# Altium schematic sheet CLLC_SecondarySide_v1.SchDoc
size A; SheetNumber: 1; SheetTotal: 2
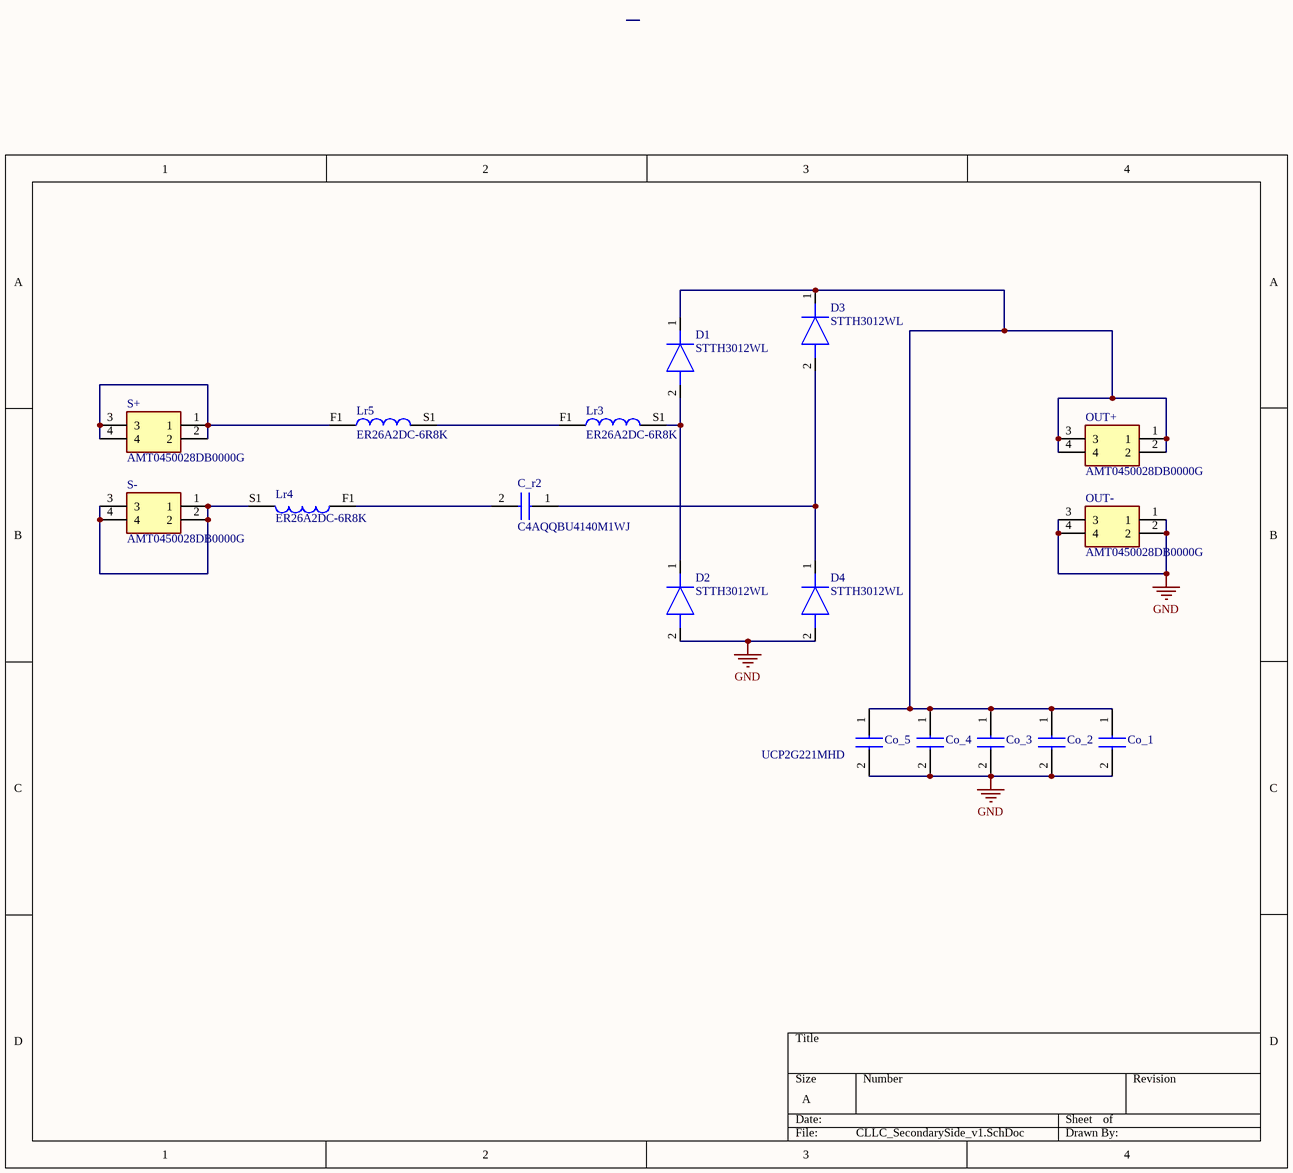
[diagram p0: CLLC_SecondarySide_v1.SchDoc]

## Parts
C_r2  C4AQQBU4140M1WJ  [C4AQQBU4140M1WJ]
Co_1  UCP2G221MHD  [CAPPRD750W80D1800H4800]  (value not drawn)
Co_2  UCP2G221MHD  [CAPPRD750W80D1800H4800]  (value not drawn)
Co_3  UCP2G221MHD  [CAPPRD750W80D1800H4800]  (value not drawn)
Co_4  UCP2G221MHD  [CAPPRD750W80D1800H4800]  (value not drawn)
Co_5  UCP2G221MHD  [CAPPRD750W80D1800H4800]
D1  STTH3012WL  [TO1088P531X1588X2596-2P]
D2  STTH3012WL  [TO1088P531X1588X2596-2P]
D3  STTH3012WL  [TO1088P531X1588X2596-2P]
D4  STTH3012WL  [TO1088P531X1588X2596-2P]
Lr3  ER26A2DC-6R8K  [ER26A2DC6R8K]
Lr4  ER26A2DC-6R8K  [ER26A2DC6R8K]
Lr5  ER26A2DC-6R8K  [ER26A2DC6R8K]
OUT+  AMT0450028DB0000G  [AMT0450028DB0000G]
OUT-  AMT0450028DB0000G  [AMT0450028DB0000G]
S+  AMT0450028DB0000G  [AMT0450028DB0000G]
S-  AMT0450028DB0000G  [AMT0450028DB0000G]

## Nets
GND: Co_1.2(-) Co_2.2(-) Co_3.2(-) Co_4.2(-) Co_5.2(-) D2.2(A) D4.2(A) OUT-.1 OUT-.2 OUT-.3 OUT-.4
NetC_r2_1: C_r2.1 D3.2(A) D4.1(K)
NetC_r2_2: C_r2.2 Lr4.F1
NetCo_1_1: Co_1.1(+) Co_2.1(+) Co_3.1(+) Co_4.1(+) Co_5.1(+) D1.1(K) D3.1(K) OUT+.1 OUT+.2 OUT+.3 OUT+.4
NetD1_2: D1.2(A) D2.1(K) Lr3.S1
NetLr3_F1: Lr3.F1 Lr5.S1
NetLr4_S1: Lr4.S1 S-.1 S-.2 S-.3 S-.4
NetLr5_F1: Lr5.F1 S+.1 S+.2 S+.3 S+.4

## Library data of the parts
C_r2 = C4AQQBU4140M1WJ: Capacitor; Manufacturer_Name: KEMET; Datasheet Link: https://search.kemet.com/component-documentation/download/specsheet/C4AQQBU4140M1WJ; Height: 20.2mm; Manufacturer_Part_Number: C4AQQBU4140M1WJ; Mouser Part Number: 80-C4AQQBU4140M1WJ; Mouser Price/Stock: https://www.mouser.co.uk/ProductDetail/KEMET/C4AQQBU4140M1WJ?qs=81r%252BiQLm7BSMlBltxrghzA%3D%3D
Co_1-Co_5 = UCP2G221MHD: Capacitor; Manufacturer_Name: Nichicon; Datasheet Link: https://componentsearchengine.com/Datasheets/1/UCP2G221MHD.pdf; Height: 48mm; Manufacturer_Part_Number: UCP2G221MHD; Mouser Part Number: 647-UCP2G221MHD; Mouser Price/Stock: https://www.mouser.co.uk/ProductDetail/Nichicon/UCP2G221MHD?qs=iCzJi%2FIZBF51iuUvn3RRMQ%3D%3D
D1-D4 = STTH3012WL: Diode; Manufacturer_Name: STMicroelectronics; Datasheet Link: https://www.st.com/resource/en/datasheet/stth3012.pdf; Height: 5.31mm; Manufacturer_Part_Number: STTH3012WL; Mouser Part Number: 511-STTH3012WL; Mouser Price/Stock: https://www.mouser.co.uk/ProductDetail/STMicroelectronics/STTH3012WL?qs=tlsG%2FOw5FFj6CHRXwq6hOA%3D%3D; Arrow Part Number: STTH3012WL; Arrow Price/Stock: https://www.arrow.com/en/products/stth3012wl/stmicroelectronics?region=nac
Lr3-Lr5 = ER26A2DC-6R8K: Inductor; Manufacturer_Name: Bourns; Datasheet Link: https://www.bourns.com/docs/product-datasheets/er26a.pdf; Height: 17mm; Manufacturer_Part_Number: ER26A2DC-6R8K
OUT+ OUT- S+ S- = AMT0450028DB0000G: Connector; Manufacturer_Name: Amphenol; Datasheet Link: https://www.anytek.com.cn/Upload/AMT45028DB-821f25108d7e4e0caa268ff3448ada5b.pdf; Height: 7.4mm; Manufacturer_Part_Number: AMT0450028DB0000G; Mouser Part Number: 523-AMT0450028DB000G; Mouser Price/Stock: https://www.mouser.co.uk/ProductDetail/Amphenol-Anytek/AMT0450028DB0000G?qs=ST9lo4GX8V0in%252BhOLfQ9xA%3D%3D